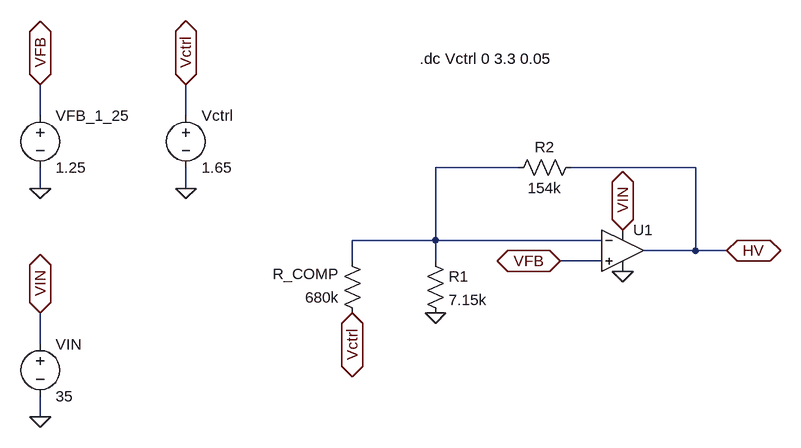
[diagram p0: schematic HV_SiPM.asc]
HV_SiPM.asc, the LTspice schematic file:
Version 4.1
SHEET 1 1016 680
WIRE -688 -48 -688 -96
WIRE -464 -48 -464 -96
WIRE 48 32 -80 32
WIRE 320 32 128 32
WIRE -688 64 -688 32
WIRE -464 64 -464 32
WIRE -80 144 -80 32
WIRE -80 144 -208 144
WIRE 176 144 -80 144
WIRE 320 160 320 32
WIRE 320 160 240 160
WIRE 368 160 320 160
WIRE -208 176 -208 144
WIRE -80 176 -80 144
WIRE 176 176 112 176
WIRE -688 304 -688 256
WIRE -688 416 -688 384
FLAG -688 -96 VFB
IOPIN -688 -96 BiDir
FLAG 112 176 VFB
IOPIN 112 176 BiDir
FLAG -80 256 0
FLAG 368 160 HV
IOPIN 368 160 BiDir
FLAG -464 -96 Vctrl
IOPIN -464 -96 BiDir
FLAG -208 256 Vctrl
IOPIN -208 256 BiDir
FLAG -688 256 VIN
IOPIN -688 256 BiDir
FLAG 208 128 VIN
IOPIN 208 128 BiDir
FLAG 208 192 0
FLAG -464 64 0
FLAG -688 64 0
FLAG -688 416 0
SYMBOL voltage -688 -64 R0
SYMATTR InstName VFB_1_25
SYMATTR Value 1.25
SYMBOL res 144 16 R90
WINDOW 0 0 56 VBottom 2
WINDOW 3 32 56 VTop 2
SYMATTR InstName R2
SYMATTR Value 154k
SYMBOL res -96 160 R0
SYMATTR InstName R1
SYMATTR Value 7.15k
SYMBOL voltage -464 -64 R0
WINDOW 123 0 0 Left 0
WINDOW 39 0 0 Left 0
SYMATTR InstName Vctrl
SYMATTR Value 1.65
SYMBOL res -192 272 R180
WINDOW 0 36 76 Left 2
WINDOW 3 36 40 Left 2
SYMATTR InstName R_COMP
SYMATTR Value 680k
SYMBOL OpAmps\\UniversalOpAmp2 208 160 R0
SYMATTR InstName U1
SYMBOL voltage -688 288 R0
SYMATTR InstName VIN
SYMATTR Value 35
TEXT -104 -136 Left 2 !.dc Vctrl 0 3.3 0.05

The netlist it stands for:
* HV_SiPM.asc
VFB_1_25 VFB 0 1.25
R2 HV N001 154k
R1 N001 0 7.15k
Vctrl Vctrl 0 1.65
R_COMP Vctrl N001 680k
X§U1 VFB N001 VIN 0 HV level2 Avol=1Meg GBW=10Meg Slew=10Meg Ilimit=25m Rail=0 Vos=0 En=0 Enk=0 In=0 Ink=0 Rin=500Meg  ; pins In+ In- V+ V- OUT
VIN VIN 0 35
.dc Vctrl 0 3.3 0.05
.lib UniversalOpAmp2.lib
.backanno
.end